# Altium schematic sheet signal-light-14.SchDoc
size A4; SheetNumber: 17; SheetTotal: 21
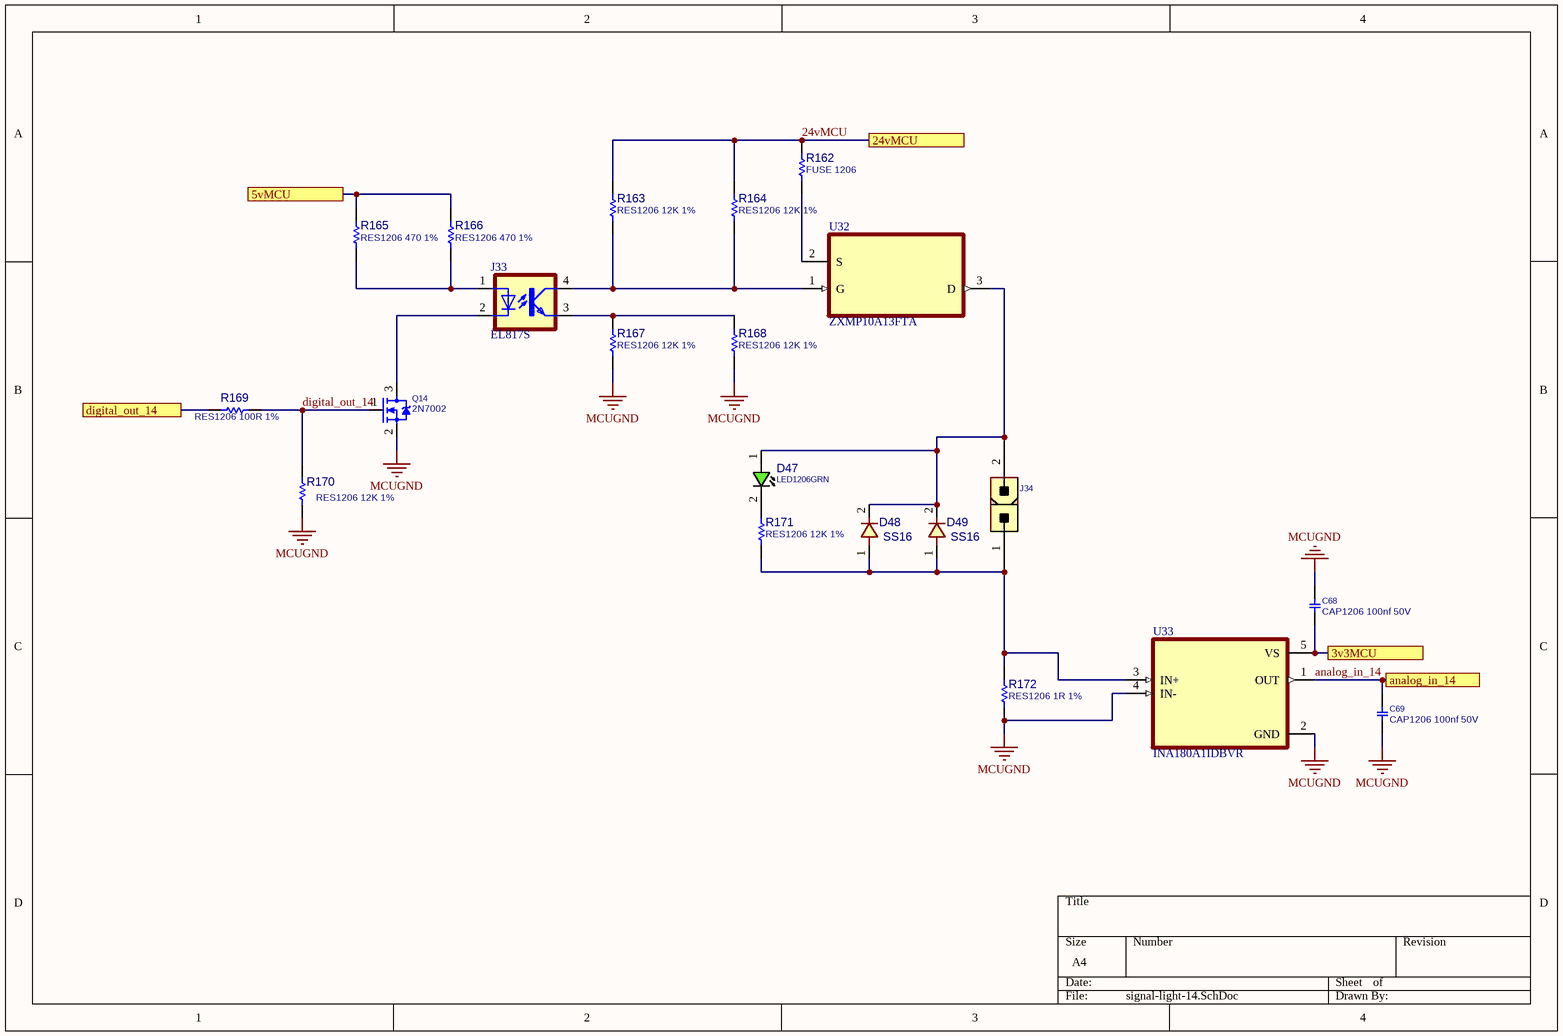
[diagram p0: signal-light-14.SchDoc]

## Parts
C68  CAP1206 100nf 50V  [C1206]
C69  CAP1206 100nf 50V  [C1206]
D47  LED1206GRN  [LED1206GRN]
D48  SS16  [D_SMA]
D49  SS16  [D_SMA]
J33  EL817S  [SOIC254P1030X460-4N]
J34  CONN_ATXPWR_2  [ATXPWR_2]  (value not drawn)
Q14  2N7002  [SOT23_3]
R162  FUSE 1206  [R1206]
R163  RES1206 12K 1%  [R1206]
R164  RES1206 12K 1%  [R1206]
R165  RES1206 470 1%  [R1206]
R166  RES1206 470 1%  [R1206]
R167  RES1206 12K 1%  [R1206]
R168  RES1206 12K 1%  [R1206]
R169  RES1206 100R 1%  [R1206]
R170  RES1206 12K 1%  [R1206]
R171  RES1206 12K 1%  [R1206]
R172  RES1206 1R 1%  [R1206]
U32  ZXMP10A13FTA  [SOT95P230X110-3N]
U33  INA180A1IDBVR  [SOT95P280X145-5N]

## Ports
3v3MCU, 5vMCU, 24vMCU, analog_in_14, digital_out_14

## Nets
MCUGND: C68.1 C69.2 Q14.2(SOURCE) R167.2 R168.2 R170.2 R172.2 U33.2(GND) U33.4(IN-)
3v3MCU: C68.2 U33.5(VS) ; port 3v3MCU
5vMCU: R165.2 R166.2 ; port 5vMCU
24vMCU: R162.1 R163.1 R164.1 ; port 24vMCU
analog_in_14: C69.1 U33.1(OUT) ; port analog_in_14
digital_out_14: Q14.1(GATE) R169.2 R170.1
digital_out_14: R169.1 ; port digital_out_14  [a separate net that carries the same name]
NetD47_1: D47.1(ANODE) D48.2 D49.2 J34.2 U32.3(D)
NetD47_2: D47.2(CATHODE) R171.1
NetD48_1: D48.1 D49.1 J34.1 R171.2 R172.1 U33.3(IN+)
NetJ33_1: J33.1(A) R165.1 R166.1
NetJ33_2: J33.2(C) Q14.3(DRAIN)
NetJ33_3: J33.3(EMIT) R167.1 R168.1
NetJ33_4: J33.4(COL) R163.2 R164.2 U32.1(G)
NetR162_2: R162.2 U32.2(S)

## Library data of the parts
C68 C69 = CAP_SMD_MLCC_1206: CAP, MLCC; PARAM: -, -%; MANF_P#: MANF_PART#; PARAM2: -V; PRICE: 100= 1$; MANF: -; ASSEMBLY: ASSEMBLY
D47 = LED_SMD_1206_GRN: LED, SMD, 1206, GREEN; PARAM: 20mA; DESC: DESCRIPTION; PARAM2: 2.2V; MANF: -; ASSEMBLY: ASSEMBLY; PRICE: 36t@Javan; MANF_P#: -; VALUE: LED1206GRN; MountType: SMT; PartType: LED
D48 D49 = DIODE_SMD_1N4001: DIODE, GENERAL PURPOSE, 50V/1A; DESC: DESCRIPTION; PARAM: 50V VRRM; PARAM2: 1A; MANF_P#: 1N4001; MANF: MANF; ASSEMBLY: ASSEMBLY; PRICE: PRICE; VALUE: SS16
J33 = EL817S: Optoisolator Transistor Output 5000Vrms 1 Channel 4-SMD; MF: Everlight Electronics; SnapEDA_Link: https://www.snapeda.com/parts/EL817S/Everlight+Electronics+Co+Ltd/view-part/?ref=snap; Package: SMD-4 Everlight Electronics Co Ltd; Value: *; MP: EL817S; Check_prices: https://www.snapeda.com/parts/EL817S/Everlight+Electronics+Co+Ltd/view-part/?ref=eda
J34 = CONN_ATXPWR_2: CONN, ATX POWER, 2 P; MANF: Molex; MANF_P#: 39281023; VALUE: CONN_ATXPWR_2; MountType: THD; PACKAGE: ATXPWR-2pin; Part Type: Conn.
Q14 = MOSN_2N7002_SOT23: MOSFET, N-CH, 60V, 0.3A; MANF: NXP; ASSEMBLY: ASSEMBLY; MANF_P#: 2N7002; PARAM2: 60v; PARAM: 0.3A; PRICE: 0.3t@Javan; VALUE: 2N7002
R162-R172 = RES_SMD_1206: RESISTOR, SMD; PARAM: 1%, 0.25W; DESC: DESCRIPTION; DIST#: MOUSER; MANF_P#: -; MANF: -; ASSEMBLY: ASSEMBLY; PRICE: -; PARAM2: -
U32 = ZXMP10A13FTA: P-Channel 100 V 600mA (Ta) 625mW (Ta) Surface Mount SOT-23-3; MF: Diodes Inc.; Purchase-URL: https://pricing.snapeda.com/search/part/ZXMP10A13FTA/?ref=eda; Package: SOT-23-3 Diodes Inc.; SnapEDA_Link: https://www.snapeda.com/parts/ZXMP10A13FTA/Diodes+Inc./view-part/?ref=snap; Availability: In Stock; Value: *; MP: ZXMP10A13FTA; Check_prices: https://www.snapeda.com/parts/ZXMP10A13FTA/Diodes+Inc./view-part/?ref=eda; Price: None
U33 = INA180A1IDBVR: 26V, 350kHz current sense amplifier; MF: Texas Instruments; SnapEDA_Link: https://www.snapeda.com/parts/INA180A1IDBVR/Texas+Instruments/view-part/?ref=snap; Package: SOT-23-5 Texas Instruments; Value: *; MP: INA180A1IDBVR; Check_prices: https://www.snapeda.com/parts/INA180A1IDBVR/Texas+Instruments/view-part/?ref=eda